# Altium schematic sheet connect.SchDoc
size A; SheetNumber: 2; SheetTotal: 4
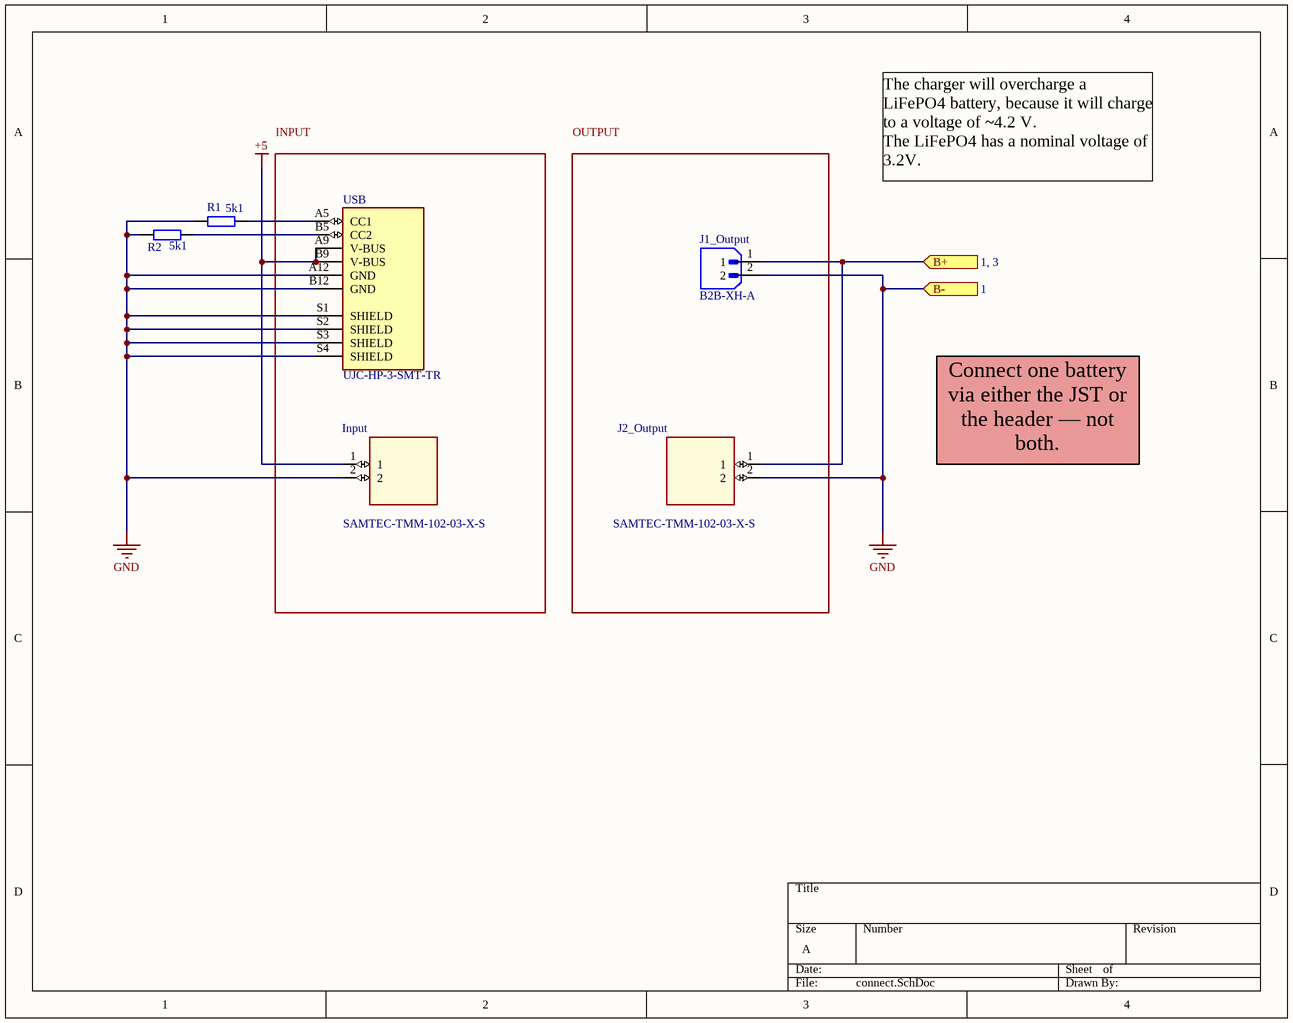
[diagram p0: connect.SchDoc]

## Parts
Input  SAMTEC-TMM-102-03-X-S  [SAMTEC-TMM-102-03-X-S]
J1_Output  B2B-XH-A  [JST_B2B-XH-A]
J2_Output  SAMTEC-TMM-102-03-X-S  [SAMTEC-TMM-102-03-X-S]
R1  5k1  [RES_0603]
R2  5k1  [RES_0603]
USB  UJC-HP-3-SMT-TR  [CUI_UJC-HP-3-SMT-TR]

## Blocks framed on the sheet
INPUT: Input USB
OUTPUT: J1_Output J2_Output

## Ports
B+ (in, see 1, 3), B- (in, see 1)

## Nets
+5: Input.1 USB.A9(V-BUS) USB.B9(V-BUS)
GND: Input.2 J1_Output.2 J2_Output.2 R1.1 R2.1 USB.A12(GND) USB.B12(GND) USB.S1(SHIELD) USB.S2(SHIELD) USB.S3(SHIELD) USB.S4(SHIELD) ; port B-
B+: J1_Output.1 J2_Output.1 ; port B+
NetR1_2: R1.2 USB.A5(CC1)
NetR2_2: R2.2 USB.B5(CC2)

## Notes on the sheet
- The charger will overcharge a LiFePO4 battery, because it will charge to a voltage of ~4.2 V.
  The LiFePO4 has a nominal voltage of 3.2V.
- Connect one battery via either the JST or the header — not both.

## Library data of the parts
J1_Output = B2B-XH-A: MF: {'manufacturer': u'JST Sales America Inc.'}; Package: None; Price: None; Value: *; MP: B2B-XH-A; Availability: Unavailable
R1 R2 = RES_0603: Resistor SMD 0603; Manufacturer: *; Manufacturer Part Number: *; Distributor Link: *; LCSC: *
Input J2_Output = SAMTEC-TMM-102-03-X-S: Price: None; Value: *; MP: SAMTEC-TMM-102-03-X-S; Availability: Unavailable; Package: None
USB = UJC-HP-3-SMT-TR: Package: None; Price: None; Value: *; MP: UJC-HP-3-SMT-TR; Availability: Unavailable